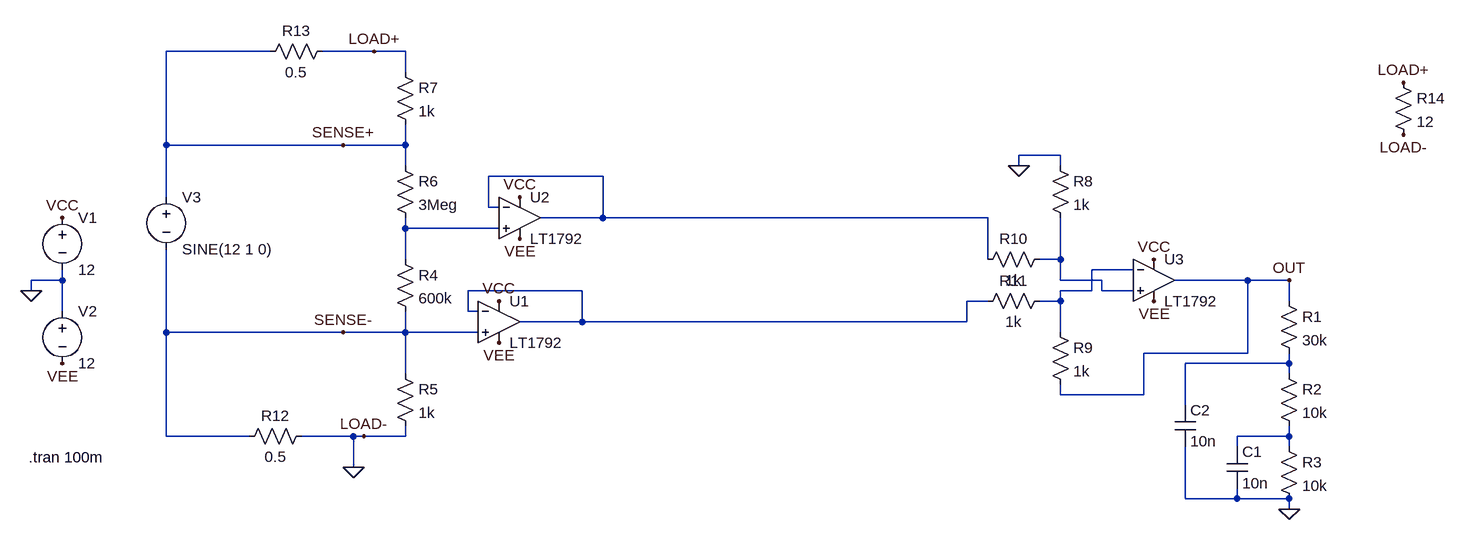
[diagram p0: schematic dc_load_sensing.asc]
dc_load_sensing.asc, the LTspice schematic file:
Version 4
SHEET 1 1684 680
WIRE -128 -208 -288 -208
WIRE 32 -208 -48 -208
WIRE 80 -208 32 -208
WIRE 80 -176 80 -208
WIRE -288 -64 -288 -208
WIRE -16 -64 -288 -64
WIRE 80 -64 80 -96
WIRE 80 -64 -16 -64
WIRE 1088 -48 1024 -48
WIRE 80 -32 80 -64
WIRE 1024 -32 1024 -48
WIRE 1088 -32 1088 -48
WIRE 384 -16 208 -16
WIRE -288 16 -288 -64
WIRE 208 32 208 -16
WIRE 224 32 208 32
WIRE 384 48 384 -16
WIRE 384 48 288 48
WIRE 976 48 384 48
WIRE 80 64 80 48
WIRE 224 64 80 64
WIRE 80 112 80 64
WIRE 976 112 976 48
WIRE 1088 112 1088 48
WIRE 1088 112 1056 112
WIRE 1200 128 1136 128
WIRE -448 144 -448 128
WIRE -448 144 -496 144
WIRE 1088 144 1088 112
WIRE 1152 144 1088 144
WIRE 1376 144 1264 144
WIRE 1440 144 1376 144
WIRE -496 160 -496 144
WIRE 352 160 176 160
WIRE 1136 160 1136 128
WIRE 1136 160 1088 160
WIRE 1152 160 1152 144
WIRE 1200 160 1152 160
WIRE 976 176 944 176
WIRE 1088 176 1088 160
WIRE 1088 176 1056 176
WIRE 1440 176 1440 144
WIRE -448 192 -448 144
WIRE 176 192 176 160
WIRE 192 192 176 192
WIRE 352 208 352 160
WIRE 352 208 256 208
WIRE 944 208 944 176
WIRE 944 208 352 208
WIRE -288 224 -288 96
WIRE -16 224 -288 224
WIRE 80 224 80 192
WIRE 80 224 -16 224
WIRE 192 224 80 224
WIRE 1088 224 1088 176
WIRE 1376 256 1376 144
WIRE 1376 256 1216 256
WIRE 1440 272 1440 256
WIRE 1440 272 1280 272
WIRE 80 288 80 224
WIRE 1440 288 1440 272
WIRE 1088 320 1088 304
WIRE 1216 320 1216 256
WIRE 1216 320 1088 320
WIRE 1280 336 1280 272
WIRE -288 384 -288 224
WIRE -160 384 -288 384
WIRE 0 384 -80 384
WIRE 16 384 0 384
WIRE 80 384 80 368
WIRE 80 384 16 384
WIRE 1440 384 1440 368
WIRE 1440 384 1360 384
WIRE 1360 400 1360 384
WIRE 1440 400 1440 384
WIRE 0 432 0 384
WIRE 1280 480 1280 400
WIRE 1360 480 1360 464
WIRE 1360 480 1280 480
WIRE 1440 480 1360 480
WIRE 1440 496 1440 480
FLAG -496 160 0
FLAG -448 48 VCC
FLAG -448 272 VEE
FLAG 1232 112 VCC
FLAG 1232 176 VEE
FLAG 1440 496 0
FLAG 1024 -32 0
FLAG 0 432 0
FLAG 32 -208 LOAD+
FLAG 16 384 LOAD-
FLAG -16 -64 SENSE+
FLAG -16 224 SENSE-
FLAG 1616 -160 LOAD+
FLAG 1616 -80 LOAD-
FLAG 1440 144 OUT
FLAG 256 16 VCC
FLAG 224 176 VCC
FLAG 224 240 VEE
FLAG 256 80 VEE
SYMBOL voltage -448 32 R0
WINDOW 123 0 0 Left 2
WINDOW 39 0 0 Left 2
SYMATTR InstName V1
SYMATTR Value 12
SYMBOL voltage -448 176 R0
WINDOW 123 0 0 Left 2
WINDOW 39 0 0 Left 2
SYMATTR InstName V2
SYMATTR Value 12
SYMBOL res 1424 160 R0
SYMATTR InstName R1
SYMATTR Value 30k
SYMBOL res 1424 272 R0
SYMATTR InstName R2
SYMATTR Value 10k
SYMBOL res 1424 384 R0
SYMATTR InstName R3
SYMATTR Value 10k
SYMBOL cap 1344 400 R0
SYMATTR InstName C1
SYMATTR Value 10n
SYMBOL cap 1264 336 R0
SYMATTR InstName C2
SYMATTR Value 10n
SYMBOL res 64 96 R0
SYMATTR InstName R4
SYMATTR Value 600k
SYMBOL res 64 272 R0
SYMATTR InstName R5
SYMATTR Value 1k
SYMBOL res 64 -48 R0
SYMATTR InstName R6
SYMATTR Value 3Meg
SYMBOL res 64 -192 R0
SYMATTR InstName R7
SYMATTR Value 1k
SYMBOL res 1072 -48 R0
SYMATTR InstName R8
SYMATTR Value 1k
SYMBOL res 1072 208 R0
SYMATTR InstName R9
SYMATTR Value 1k
SYMBOL res 1072 96 R90
WINDOW 0 0 56 VBottom 2
WINDOW 3 32 56 VTop 2
SYMATTR InstName R10
SYMATTR Value 1k
SYMBOL res 1072 160 R90
WINDOW 0 0 56 VBottom 2
WINDOW 3 32 56 VTop 2
SYMATTR InstName R11
SYMATTR Value 1k
SYMBOL res -64 368 R90
WINDOW 0 0 56 VBottom 2
WINDOW 3 32 56 VTop 2
SYMATTR InstName R12
SYMATTR Value 0.5
SYMBOL res -32 -224 R90
WINDOW 0 0 56 VBottom 2
WINDOW 3 32 56 VTop 2
SYMATTR InstName R13
SYMATTR Value 0.5
SYMBOL voltage -288 0 R0
WINDOW 123 0 0 Left 2
WINDOW 39 0 0 Left 2
SYMATTR InstName V3
SYMATTR Value SINE(12 1 0)
SYMBOL res 1600 -176 R0
SYMATTR InstName R14
SYMATTR Value 12
SYMBOL Opamps\\LT1792 224 144 R0
SYMATTR InstName U1
SYMBOL Opamps\\LT1792 256 -16 R0
SYMATTR InstName U2
SYMBOL Opamps\\LT1792 1232 80 R0
SYMATTR InstName U3
TEXT -500 416 Left 2 !.tran 100m

The netlist it stands for:
* dc_load_sensing.asc
V1 VCC 0 12
V2 0 VEE 12
R1 OUT N006 30k
R2 N006 N007 10k
R3 N007 0 10k
C1 N007 0 10n
C2 N006 0 10n
R4 N002 SENSE- 600k
R5 SENSE- 0 1k
R6 SENSE+ N002 3Meg
R7 LOAD+ SENSE+ 1k
R8 0 N003 1k
R9 N004 OUT 1k
R10 N003 N001 1k
R11 N004 N005 1k
R12 0 SENSE- 0.5
R13 LOAD+ SENSE+ 0.5
V3 SENSE+ SENSE- SINE(12 1 0)
R14 LOAD+ 0 12
XU1 SENSE- N005 VCC VEE N005 LT1792  ; pins In+ In- V+ V- OUT
XU2 N002 N001 VCC VEE N001 LT1792  ; pins In+ In- V+ V- OUT
XU3 N003 N004 VCC VEE OUT LT1792  ; pins In+ In- V+ V- OUT
.tran 100m
.backanno
.end